# Altium schematic sheet Top-Sheet.SchDoc
size A4; SheetNumber: 1; SheetTotal: 4
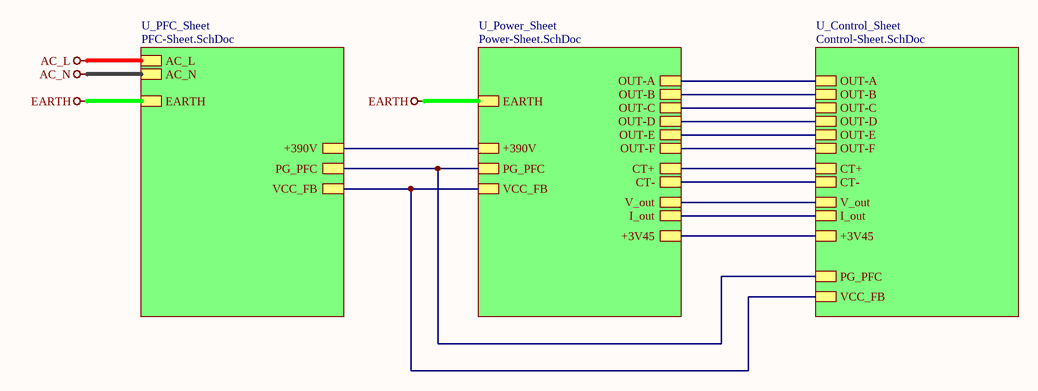
[diagram p0: Top-Sheet.SchDoc]

## Sub-sheets
U_Control_Sheet = Control-Sheet.SchDoc: CT+, CT-, OUT-A, OUT-B, OUT-C, OUT-D, OUT-E, OUT-F, V_out, I_out, +3V45, PG_PFC, VCC_FB
U_PFC_Sheet = PFC-Sheet.SchDoc: AC_L, EARTH, AC_N, +390V, PG_PFC, VCC_FB
U_Power_Sheet = Power-Sheet.SchDoc: OUT-A, OUT-B, PG_PFC, VCC_FB, OUT-C, EARTH, +390V, OUT-D, OUT-E, OUT-F, CT+, CT-, V_out, I_out, +3V45

## Nets
AC_L: sheet U_PFC_Sheet/AC_L
AC_N: sheet U_PFC_Sheet/AC_N
EARTH: sheet U_Power_Sheet/EARTH, sheet U_PFC_Sheet/EARTH
(unnamed): sheet U_Power_Sheet/OUT-A, sheet U_Control_Sheet/OUT-A
(unnamed): sheet U_Power_Sheet/OUT-B, sheet U_Control_Sheet/OUT-B
(unnamed): sheet U_Power_Sheet/PG_PFC, sheet U_PFC_Sheet/PG_PFC, sheet U_Control_Sheet/PG_PFC
(unnamed): sheet U_Power_Sheet/VCC_FB, sheet U_PFC_Sheet/VCC_FB, sheet U_Control_Sheet/VCC_FB
(unnamed): sheet U_Power_Sheet/OUT-C, sheet U_Control_Sheet/OUT-C
(unnamed): sheet U_Power_Sheet/+390V, sheet U_PFC_Sheet/+390V
(unnamed): sheet U_Power_Sheet/OUT-D, sheet U_Control_Sheet/OUT-D
(unnamed): sheet U_Power_Sheet/OUT-E, sheet U_Control_Sheet/OUT-E
(unnamed): sheet U_Power_Sheet/OUT-F, sheet U_Control_Sheet/OUT-F
(unnamed): sheet U_Power_Sheet/CT+, sheet U_Control_Sheet/CT+
(unnamed): sheet U_Power_Sheet/CT-, sheet U_Control_Sheet/CT-
(unnamed): sheet U_Power_Sheet/V_out, sheet U_Control_Sheet/V_out
(unnamed): sheet U_Power_Sheet/I_out, sheet U_Control_Sheet/I_out
(unnamed): sheet U_Power_Sheet/+3V45, sheet U_Control_Sheet/+3V45

## Notes on the sheet
- File:
- Title:
- Date:
- Page
- Num:
- Total:
- Drawn By: Huzaifa Ali